# Altium project SnakeCard_RevC.PrjPcb
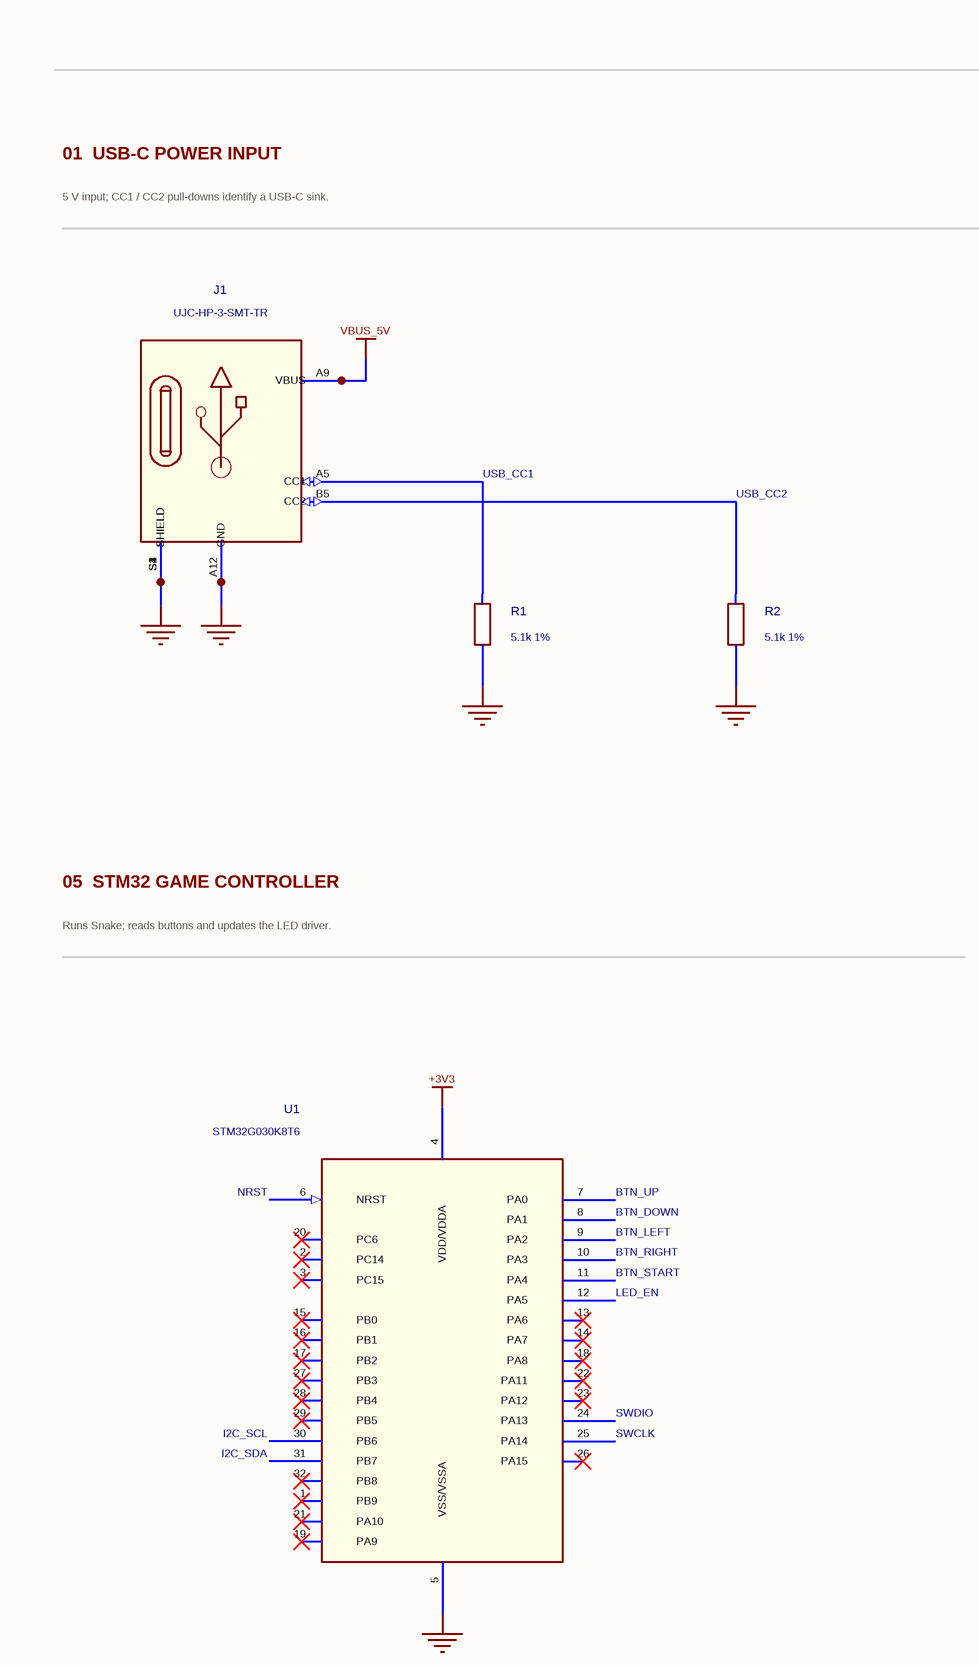
[diagram p0: SnakeCard_Native.SchDoc, top left]
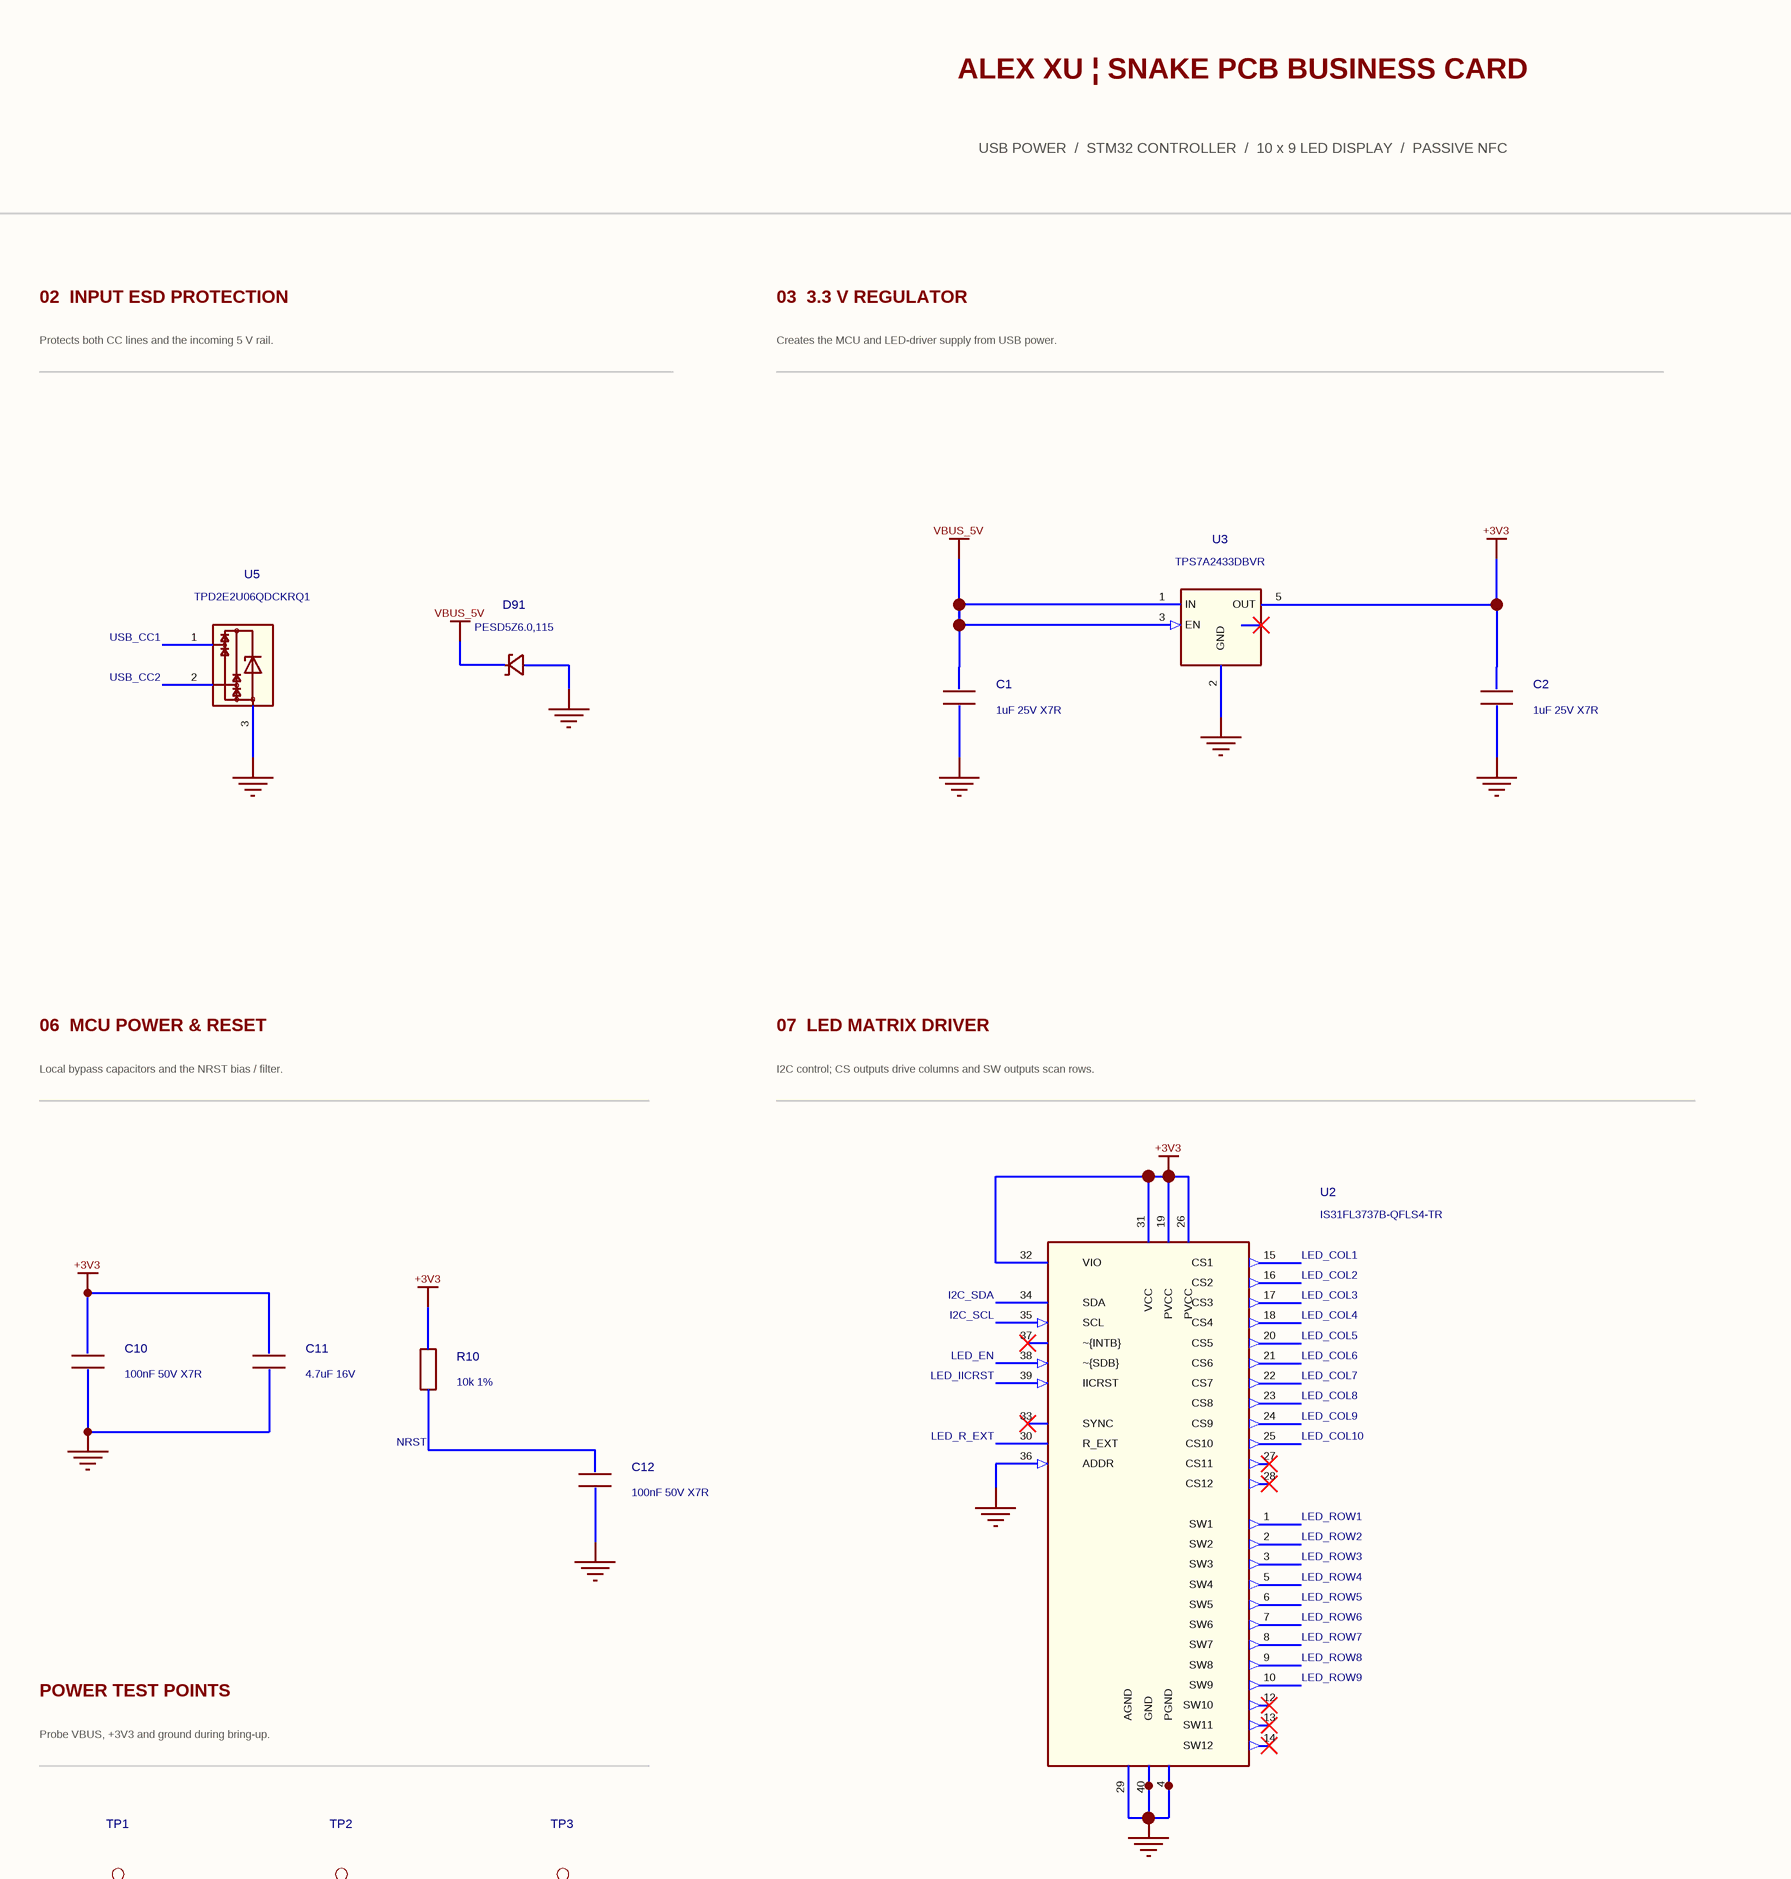
[diagram p1: SnakeCard_Native.SchDoc, top middle]
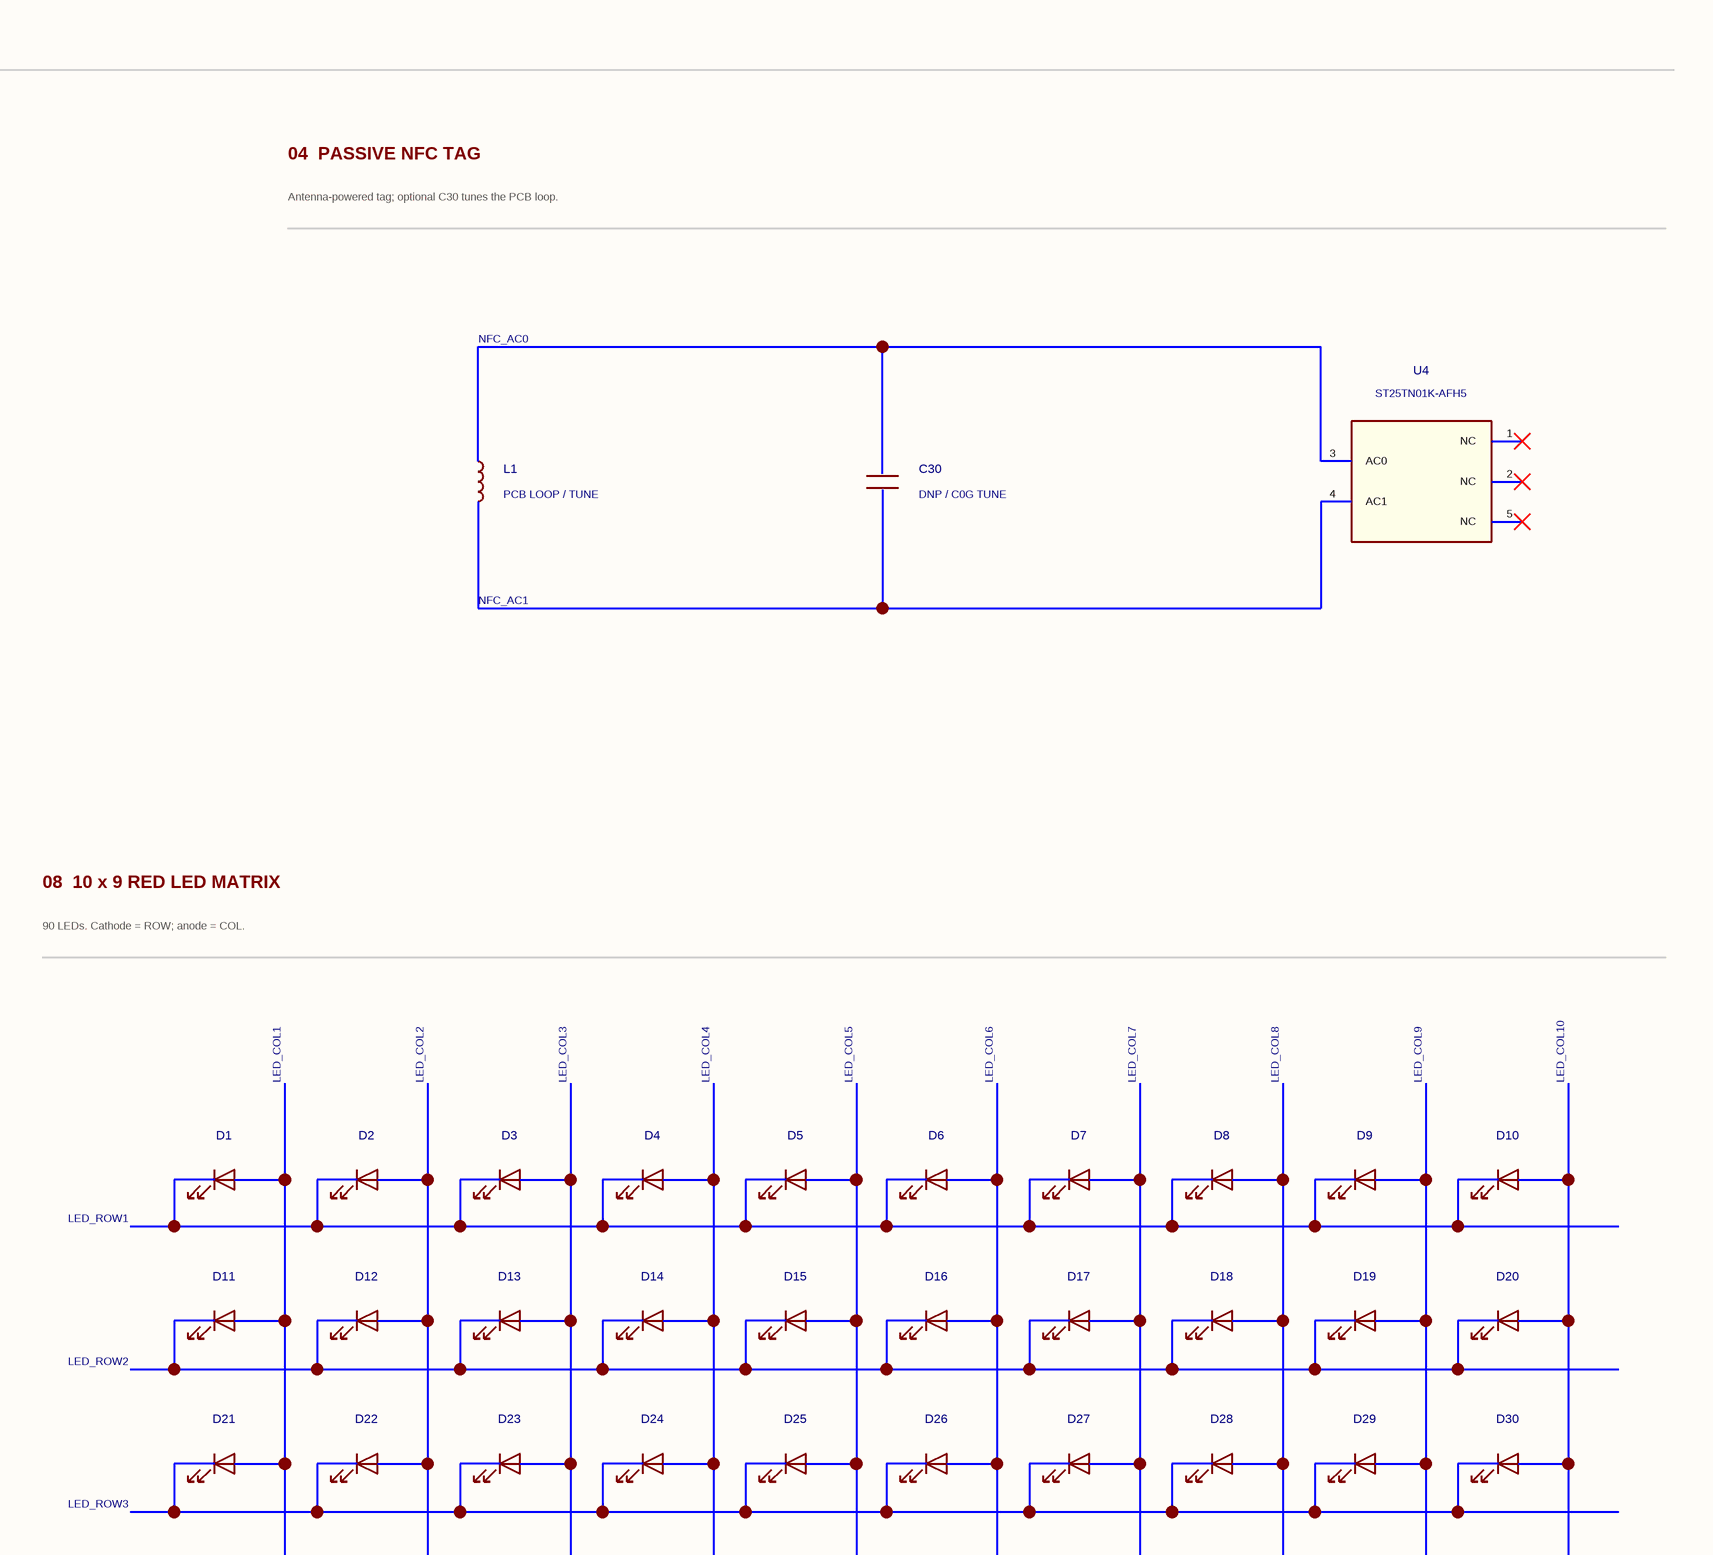
[diagram p2: SnakeCard_Native.SchDoc, top right]
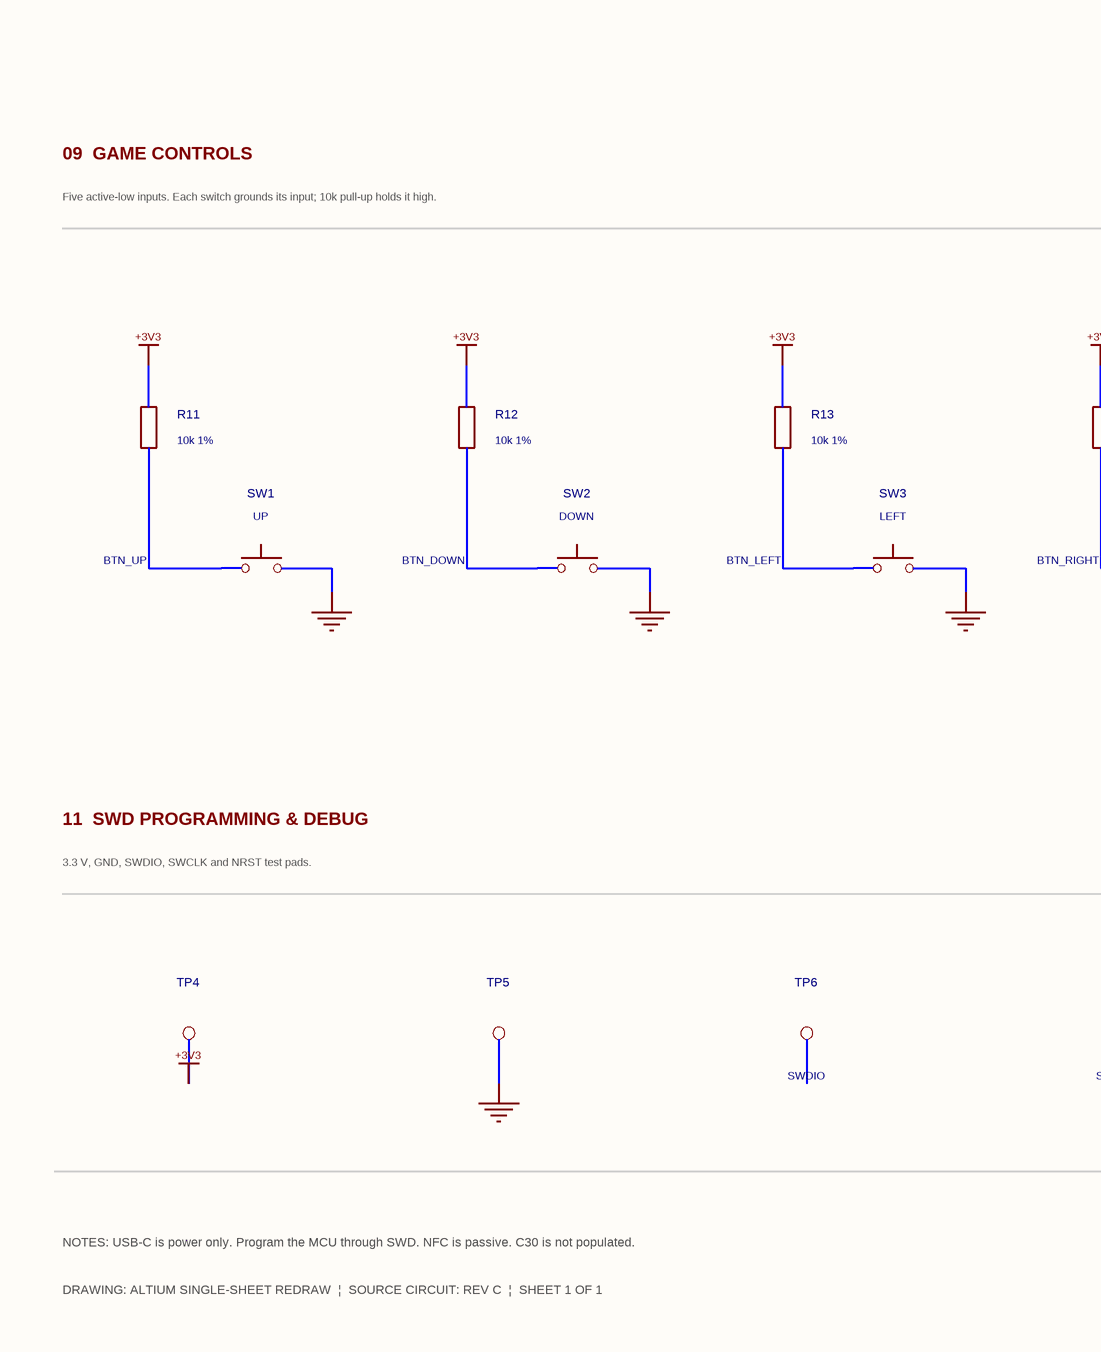
[diagram p3: SnakeCard_Native.SchDoc, bottom left]
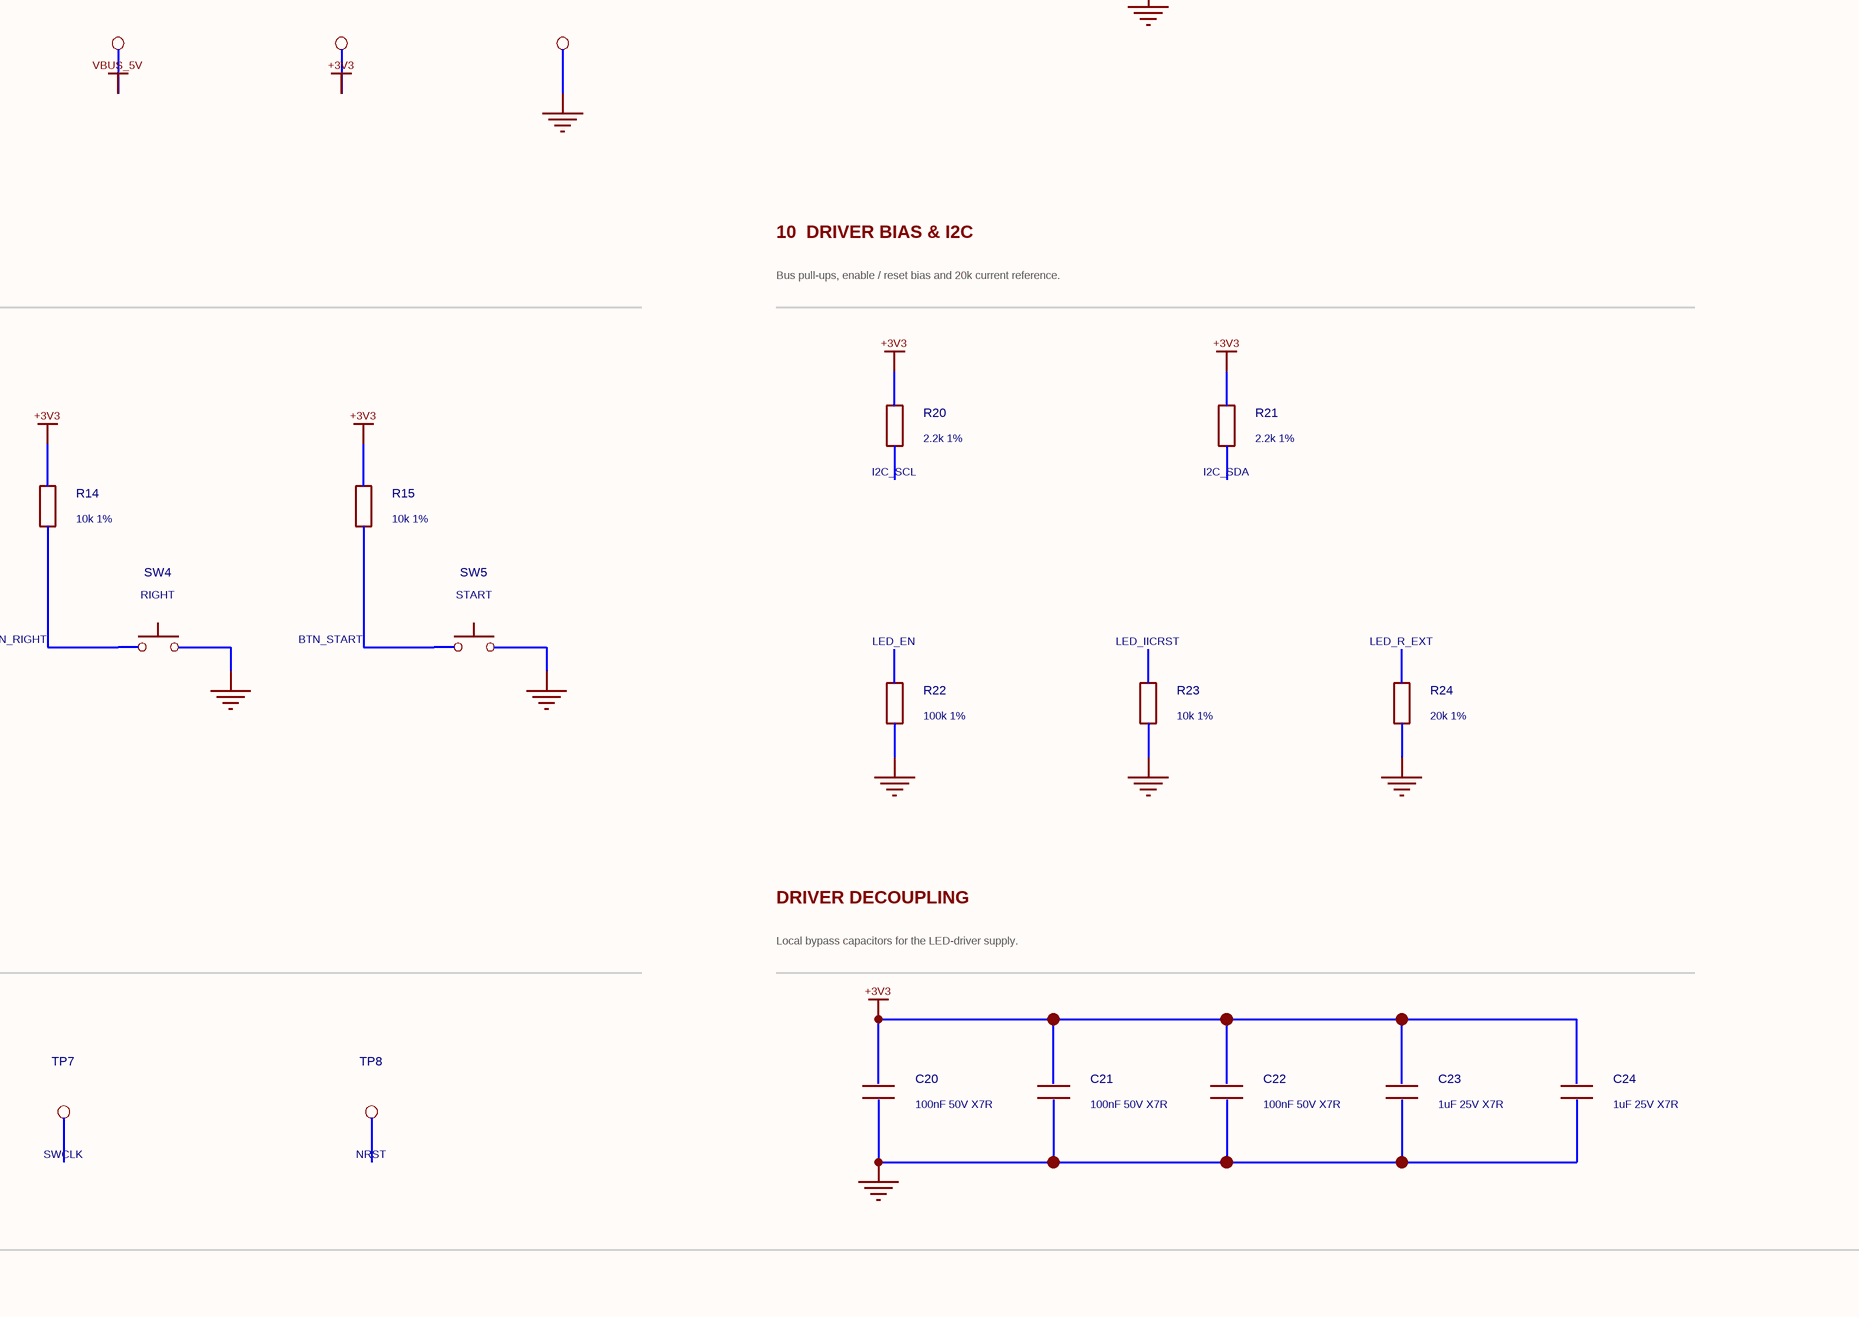
[diagram p4: SnakeCard_Native.SchDoc, bottom middle]
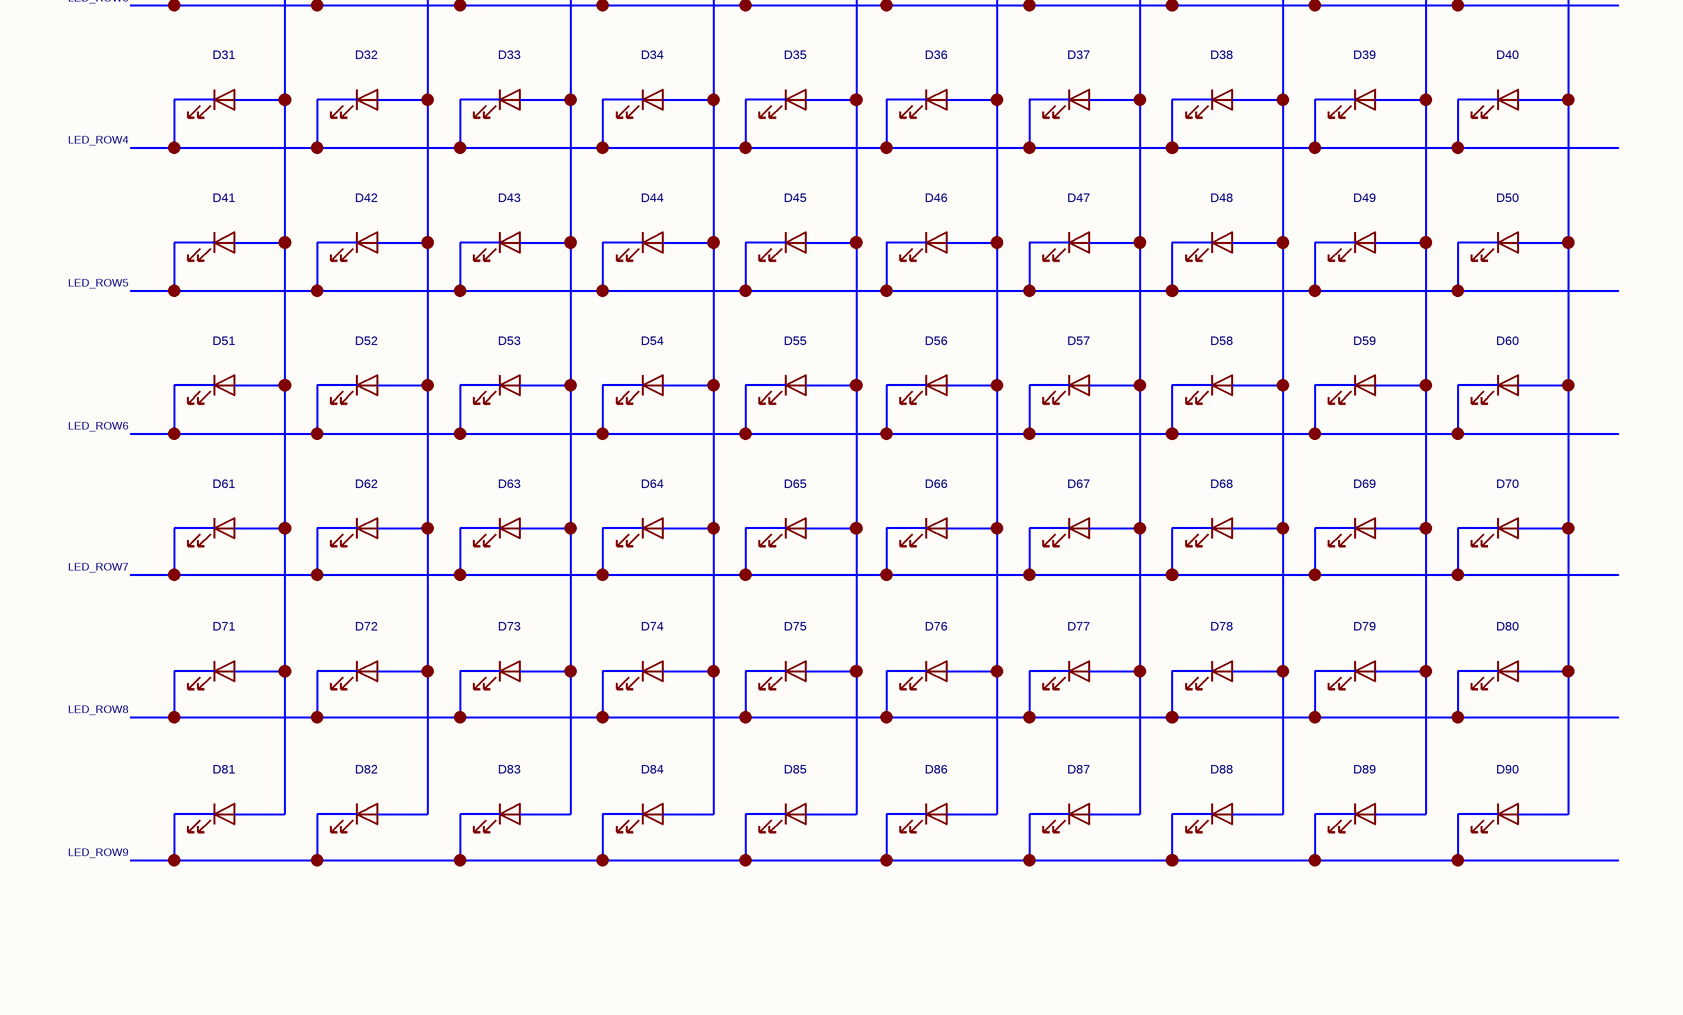
[diagram p5: SnakeCard_Native.SchDoc, bottom right]
1 sheet, 135 parts. Net scope: global (net labels, ports and power ports of the same name join across sheets).
Board file: SnakeCard_Native.PcbDoc

## Sheet SnakeCard_Native.SchDoc
size 594 x 419 mm

### Parts
C1  1uF 25V X7R  [C_0603_1608Metric]
C2  1uF 25V X7R  [C_0603_1608Metric]
C10  100nF 50V X7R  [C_0603_1608Metric]
C11  4.7uF 16V  [C_0603_1608Metric]
C12  100nF 50V X7R  [C_0603_1608Metric]
C20  100nF 50V X7R  [C_0603_1608Metric]
C21  100nF 50V X7R  [C_0603_1608Metric]
C22  100nF 50V X7R  [C_0603_1608Metric]
C23  1uF 25V X7R  [C_0603_1608Metric]
C24  1uF 25V X7R  [C_0603_1608Metric]
C30  DNP / C0G TUNE  [C_0603_1608Metric__DNP_NOPASTE]
D1  KT-0603R  [Kingbright_APT1608SURCK]  (value not drawn)
D2  KT-0603R  [Kingbright_APT1608SURCK]  (value not drawn)
D3  KT-0603R  [Kingbright_APT1608SURCK]  (value not drawn)
D4  KT-0603R  [Kingbright_APT1608SURCK]  (value not drawn)
D5  KT-0603R  [Kingbright_APT1608SURCK]  (value not drawn)
D6  KT-0603R  [Kingbright_APT1608SURCK]  (value not drawn)
D7  KT-0603R  [Kingbright_APT1608SURCK]  (value not drawn)
D8  KT-0603R  [Kingbright_APT1608SURCK]  (value not drawn)
D9  KT-0603R  [Kingbright_APT1608SURCK]  (value not drawn)
D10  KT-0603R  [Kingbright_APT1608SURCK]  (value not drawn)
D11  KT-0603R  [Kingbright_APT1608SURCK]  (value not drawn)
D12  KT-0603R  [Kingbright_APT1608SURCK]  (value not drawn)
D13  KT-0603R  [Kingbright_APT1608SURCK]  (value not drawn)
D14  KT-0603R  [Kingbright_APT1608SURCK]  (value not drawn)
D15  KT-0603R  [Kingbright_APT1608SURCK]  (value not drawn)
D16  KT-0603R  [Kingbright_APT1608SURCK]  (value not drawn)
D17  KT-0603R  [Kingbright_APT1608SURCK]  (value not drawn)
D18  KT-0603R  [Kingbright_APT1608SURCK]  (value not drawn)
D19  KT-0603R  [Kingbright_APT1608SURCK]  (value not drawn)
D20  KT-0603R  [Kingbright_APT1608SURCK]  (value not drawn)
D21  KT-0603R  [Kingbright_APT1608SURCK]  (value not drawn)
D22  KT-0603R  [Kingbright_APT1608SURCK]  (value not drawn)
D23  KT-0603R  [Kingbright_APT1608SURCK]  (value not drawn)
D24  KT-0603R  [Kingbright_APT1608SURCK]  (value not drawn)
D25  KT-0603R  [Kingbright_APT1608SURCK]  (value not drawn)
D26  KT-0603R  [Kingbright_APT1608SURCK]  (value not drawn)
D27  KT-0603R  [Kingbright_APT1608SURCK]  (value not drawn)
D28  KT-0603R  [Kingbright_APT1608SURCK]  (value not drawn)
D29  KT-0603R  [Kingbright_APT1608SURCK]  (value not drawn)
D30  KT-0603R  [Kingbright_APT1608SURCK]  (value not drawn)
D31  KT-0603R  [Kingbright_APT1608SURCK]  (value not drawn)
D32  KT-0603R  [Kingbright_APT1608SURCK]  (value not drawn)
D33  KT-0603R  [Kingbright_APT1608SURCK]  (value not drawn)
D34  KT-0603R  [Kingbright_APT1608SURCK]  (value not drawn)
D35  KT-0603R  [Kingbright_APT1608SURCK]  (value not drawn)
D36  KT-0603R  [Kingbright_APT1608SURCK]  (value not drawn)
D37  KT-0603R  [Kingbright_APT1608SURCK]  (value not drawn)
D38  KT-0603R  [Kingbright_APT1608SURCK]  (value not drawn)
D39  KT-0603R  [Kingbright_APT1608SURCK]  (value not drawn)
D40  KT-0603R  [Kingbright_APT1608SURCK]  (value not drawn)
D41  KT-0603R  [Kingbright_APT1608SURCK]  (value not drawn)
D42  KT-0603R  [Kingbright_APT1608SURCK]  (value not drawn)
D43  KT-0603R  [Kingbright_APT1608SURCK]  (value not drawn)
D44  KT-0603R  [Kingbright_APT1608SURCK]  (value not drawn)
D45  KT-0603R  [Kingbright_APT1608SURCK]  (value not drawn)
D46  KT-0603R  [Kingbright_APT1608SURCK]  (value not drawn)
D47  KT-0603R  [Kingbright_APT1608SURCK]  (value not drawn)
D48  KT-0603R  [Kingbright_APT1608SURCK]  (value not drawn)
D49  KT-0603R  [Kingbright_APT1608SURCK]  (value not drawn)
D50  KT-0603R  [Kingbright_APT1608SURCK]  (value not drawn)
D51  KT-0603R  [Kingbright_APT1608SURCK]  (value not drawn)
D52  KT-0603R  [Kingbright_APT1608SURCK]  (value not drawn)
D53  KT-0603R  [Kingbright_APT1608SURCK]  (value not drawn)
D54  KT-0603R  [Kingbright_APT1608SURCK]  (value not drawn)
D55  KT-0603R  [Kingbright_APT1608SURCK]  (value not drawn)
D56  KT-0603R  [Kingbright_APT1608SURCK]  (value not drawn)
D57  KT-0603R  [Kingbright_APT1608SURCK]  (value not drawn)
D58  KT-0603R  [Kingbright_APT1608SURCK]  (value not drawn)
D59  KT-0603R  [Kingbright_APT1608SURCK]  (value not drawn)
D60  KT-0603R  [Kingbright_APT1608SURCK]  (value not drawn)
D61  KT-0603R  [Kingbright_APT1608SURCK]  (value not drawn)
D62  KT-0603R  [Kingbright_APT1608SURCK]  (value not drawn)
D63  KT-0603R  [Kingbright_APT1608SURCK]  (value not drawn)
D64  KT-0603R  [Kingbright_APT1608SURCK]  (value not drawn)
D65  KT-0603R  [Kingbright_APT1608SURCK]  (value not drawn)
D66  KT-0603R  [Kingbright_APT1608SURCK]  (value not drawn)
D67  KT-0603R  [Kingbright_APT1608SURCK]  (value not drawn)
D68  KT-0603R  [Kingbright_APT1608SURCK]  (value not drawn)
D69  KT-0603R  [Kingbright_APT1608SURCK]  (value not drawn)
D70  KT-0603R  [Kingbright_APT1608SURCK]  (value not drawn)
D71  KT-0603R  [Kingbright_APT1608SURCK]  (value not drawn)
D72  KT-0603R  [Kingbright_APT1608SURCK]  (value not drawn)
D73  KT-0603R  [Kingbright_APT1608SURCK]  (value not drawn)
D74  KT-0603R  [Kingbright_APT1608SURCK]  (value not drawn)
D75  KT-0603R  [Kingbright_APT1608SURCK]  (value not drawn)
D76  KT-0603R  [Kingbright_APT1608SURCK]  (value not drawn)
D77  KT-0603R  [Kingbright_APT1608SURCK]  (value not drawn)
D78  KT-0603R  [Kingbright_APT1608SURCK]  (value not drawn)
D79  KT-0603R  [Kingbright_APT1608SURCK]  (value not drawn)
D80  KT-0603R  [Kingbright_APT1608SURCK]  (value not drawn)
D81  KT-0603R  [Kingbright_APT1608SURCK]  (value not drawn)
D82  KT-0603R  [Kingbright_APT1608SURCK]  (value not drawn)
D83  KT-0603R  [Kingbright_APT1608SURCK]  (value not drawn)
D84  KT-0603R  [Kingbright_APT1608SURCK]  (value not drawn)
D85  KT-0603R  [Kingbright_APT1608SURCK]  (value not drawn)
D86  KT-0603R  [Kingbright_APT1608SURCK]  (value not drawn)
D87  KT-0603R  [Kingbright_APT1608SURCK]  (value not drawn)
D88  KT-0603R  [Kingbright_APT1608SURCK]  (value not drawn)
D89  KT-0603R  [Kingbright_APT1608SURCK]  (value not drawn)
D90  KT-0603R  [Kingbright_APT1608SURCK]  (value not drawn)
D91  PESD5Z6.0,115  [D_SOD-523]
J1  UJC-HP-3-SMT-TR  [CUI_UJC-HP-3-SMT-TR]
L1  PCB LOOP / TUNE  [NFC_PRINTED_COIL_8T_UNTUNED]  (net tie, no BOM)
R1  5.1k 1%  [R_0603_1608Metric]
R2  5.1k 1%  [R_0603_1608Metric]
R10  10k 1%  [R_0603_1608Metric]
R11  10k 1%  [R_0603_1608Metric]
R12  10k 1%  [R_0603_1608Metric]
R13  10k 1%  [R_0603_1608Metric]
R14  10k 1%  [R_0603_1608Metric]
R15  10k 1%  [R_0603_1608Metric]
R20  2.2k 1%  [R_0603_1608Metric]
R21  2.2k 1%  [R_0603_1608Metric]
R22  100k 1%  [R_0603_1608Metric]
R23  10k 1%  [R_0603_1608Metric]
R24  20k 1%  [R_0603_1608Metric]
SW1  UP  [SW_SPST_SKQG_WithStem__HAND_SOLDER_NOPASTE]
SW2  DOWN  [SW_SPST_SKQG_WithStem__HAND_SOLDER_NOPASTE]
SW3  LEFT  [SW_SPST_SKQG_WithStem__HAND_SOLDER_NOPASTE]
SW4  RIGHT  [SW_SPST_SKQG_WithStem__HAND_SOLDER_NOPASTE]
SW5  START  [SW_SPST_SKQG_WithStem__HAND_SOLDER_NOPASTE]
TP1  VBUS_5V  [TestPoint_Pad_D1.0mm]  (value not drawn)
TP2  +3V3  [TestPoint_Pad_D1.0mm]  (value not drawn)
TP3  GND  [TestPoint_Pad_D1.0mm]  (value not drawn)
TP4  +3V3  [TestPoint_Pad_D1.0mm]  (value not drawn)
TP5  GND  [TestPoint_Pad_D1.0mm]  (value not drawn)
TP6  SWDIO  [TestPoint_Pad_D1.0mm]  (value not drawn)
TP7  SWCLK  [TestPoint_Pad_D1.0mm]  (value not drawn)
TP8  NRST  [TestPoint_Pad_D1.0mm]  (value not drawn)
U1  STM32G030K8T6  [LQFP-32_7x7mm_P0.8mm]
U2  IS31FL3737B-QFLS4-TR  [IS31FL3737_QFN40_5x5mm_P0.4mm_EP3.4mm]
U3  TPS7A2433DBVR  [SOT-23-5]
U4  ST25TN01K-AFH5  [ST25TN01K_UFDFPN5_1.7x1.4mm]
U5  TPD2E2U06QDCKRQ1  [SOT-323_SC-70]

### Nets
+3V3: C2.1 C10.1 C11.1 C20.1 C21.1 C22.1 C23.1 C24.1 R10.1 R11.1 R12.1 R13.1 R14.1 R15.1 R20.1 R21.1 TP2.1 TP4.1 U1.4(VDD/VDDA) U2.19(PVCC) U2.26(PVCC) U2.31(VCC) U2.32(VIO) U3.5(OUT)
GND: C1.2 C2.2 C10.2 C11.2 C12.2 C20.2 C21.2 C22.2 C23.2 C24.2 D91.2(A) J1.A12(GND) J1.B12(GND) J1.S1(SHIELD) J1.S2(SHIELD) J1.S3(SHIELD) J1.S4(SHIELD) R1.2 R2.2 R22.2 R23.2 R24.2 SW1.2 SW2.2 SW3.2 SW4.2 SW5.2 TP3.1 TP5.1 U1.5(VSS/VSSA) U2.4(PGND) U2.11(PGND) U2.29(AGND) U2.36(ADDR) U2.40(GND) U2.41(GND) U3.2(GND) U5.3
VBUS_5V: C1.1 D91.1(K) J1.A9(VBUS) J1.B9(VBUS) TP1.1 U3.1(IN) U3.3(EN)
BTN_DOWN: R12.2 SW2.1 U1.8(PA1)
BTN_LEFT: R13.2 SW3.1 U1.9(PA2)
BTN_RIGHT: R14.2 SW4.1 U1.10(PA3)
BTN_START: R15.2 SW5.1 U1.11(PA4)
BTN_UP: R11.2 SW1.1 U1.7(PA0)
I2C_SCL: R20.2 U1.30(PB6) U2.35(SCL)
I2C_SDA: R21.2 U1.31(PB7) U2.34(SDA)
LED_COL1: D1.2(A) D11.2(A) D21.2(A) D31.2(A) D41.2(A) D51.2(A) D61.2(A) D71.2(A) D81.2(A) U2.15(CS1)
LED_COL2: D2.2(A) D12.2(A) D22.2(A) D32.2(A) D42.2(A) D52.2(A) D62.2(A) D72.2(A) D82.2(A) U2.16(CS2)
LED_COL3: D3.2(A) D13.2(A) D23.2(A) D33.2(A) D43.2(A) D53.2(A) D63.2(A) D73.2(A) D83.2(A) U2.17(CS3)
LED_COL4: D4.2(A) D14.2(A) D24.2(A) D34.2(A) D44.2(A) D54.2(A) D64.2(A) D74.2(A) D84.2(A) U2.18(CS4)
LED_COL5: D5.2(A) D15.2(A) D25.2(A) D35.2(A) D45.2(A) D55.2(A) D65.2(A) D75.2(A) D85.2(A) U2.20(CS5)
LED_COL6: D6.2(A) D16.2(A) D26.2(A) D36.2(A) D46.2(A) D56.2(A) D66.2(A) D76.2(A) D86.2(A) U2.21(CS6)
LED_COL7: D7.2(A) D17.2(A) D27.2(A) D37.2(A) D47.2(A) D57.2(A) D67.2(A) D77.2(A) D87.2(A) U2.22(CS7)
LED_COL8: D8.2(A) D18.2(A) D28.2(A) D38.2(A) D48.2(A) D58.2(A) D68.2(A) D78.2(A) D88.2(A) U2.23(CS8)
LED_COL9: D9.2(A) D19.2(A) D29.2(A) D39.2(A) D49.2(A) D59.2(A) D69.2(A) D79.2(A) D89.2(A) U2.24(CS9)
LED_COL10: D10.2(A) D20.2(A) D30.2(A) D40.2(A) D50.2(A) D60.2(A) D70.2(A) D80.2(A) D90.2(A) U2.25(CS10)
LED_EN: R22.1 U1.12(PA5) U2.38(~{SDB})
LED_IICRST: R23.1 U2.39(IICRST)
LED_R_EXT: R24.1 U2.30(R_EXT)
LED_ROW1: D1.1(K) D2.1(K) D3.1(K) D4.1(K) D5.1(K) D6.1(K) D7.1(K) D8.1(K) D9.1(K) D10.1(K) U2.1(SW1)
LED_ROW2: D11.1(K) D12.1(K) D13.1(K) D14.1(K) D15.1(K) D16.1(K) D17.1(K) D18.1(K) D19.1(K) D20.1(K) U2.2(SW2)
LED_ROW3: D21.1(K) D22.1(K) D23.1(K) D24.1(K) D25.1(K) D26.1(K) D27.1(K) D28.1(K) D29.1(K) D30.1(K) U2.3(SW3)
LED_ROW4: D31.1(K) D32.1(K) D33.1(K) D34.1(K) D35.1(K) D36.1(K) D37.1(K) D38.1(K) D39.1(K) D40.1(K) U2.5(SW4)
LED_ROW5: D41.1(K) D42.1(K) D43.1(K) D44.1(K) D45.1(K) D46.1(K) D47.1(K) D48.1(K) D49.1(K) D50.1(K) U2.6(SW5)
LED_ROW6: D51.1(K) D52.1(K) D53.1(K) D54.1(K) D55.1(K) D56.1(K) D57.1(K) D58.1(K) D59.1(K) D60.1(K) U2.7(SW6)
LED_ROW7: D61.1(K) D62.1(K) D63.1(K) D64.1(K) D65.1(K) D66.1(K) D67.1(K) D68.1(K) D69.1(K) D70.1(K) U2.8(SW7)
LED_ROW8: D71.1(K) D72.1(K) D73.1(K) D74.1(K) D75.1(K) D76.1(K) D77.1(K) D78.1(K) D79.1(K) D80.1(K) U2.9(SW8)
LED_ROW9: D81.1(K) D82.1(K) D83.1(K) D84.1(K) D85.1(K) D86.1(K) D87.1(K) D88.1(K) D89.1(K) D90.1(K) U2.10(SW9)
NFC_AC0: C30.1 L1.1 U4.3(AC0)
NFC_AC1: C30.2 L1.2 U4.4(AC1)
NRST: C12.1 R10.2 TP8.1 U1.6(NRST)
SWCLK: TP7.1 U1.25(PA14)
SWDIO: TP6.1 U1.24(PA13)
USB_CC1: J1.A5(CC1) R1.1 U5.1
USB_CC2: J1.B5(CC2) R2.1 U5.2

Not connected (* = marked no-connect by the designer): U1 1(PB9)* 2(PC14)* 3(PC15)* 13(PA6)* 14(PA7)* 15(PB0)* 16(PB1)* 17(PB2)* 18(PA8)* 19(PA9)* 20(PC6)* 21(PA10)* 22(PA11)* 23(PA12)* 26(PA15)* 27(PB3)* 28(PB4)* 29(PB5)* 32(PB8)*; U2 12(SW10)* 13(SW11)* 14(SW12)* 27(CS11)* 28(CS12)* 33(SYNC)* 37(~{INTB})*; U3 4(NC)*; U4 1(NC)* 2(NC)* 5(NC)*

### Notes on the sheet
- ALEX XU | SNAKE PCB BUSINESS CARD
- USB POWER  /  STM32 CONTROLLER  /  10 x 9 LED DISPLAY  /  PASSIVE NFC
- 01  USB-C POWER INPUT
- 02  INPUT ESD PROTECTION
- 03  3.3 V REGULATOR
- 04  PASSIVE NFC TAG
- 5 V input; CC1 / CC2 pull-downs identify a USB-C sink.
- Protects both CC lines and the incoming 5 V rail.
- Creates the MCU and LED-driver supply from USB power.
- Antenna-powered tag; optional C30 tunes the PCB loop.
- 05  STM32 GAME CONTROLLER
- Runs Snake; reads buttons and updates the LED driver.
- 06  MCU POWER & RESET
- Local bypass capacitors and the NRST bias / filter.
- 07  LED MATRIX DRIVER
- I2C control; CS outputs drive columns and SW outputs scan rows.
- 08  10 x 9 RED LED MATRIX
- 90 LEDs. Cathode = ROW; anode = COL.
- POWER TEST POINTS
- Probe VBUS, +3V3 and ground during bring-up.
- 09  GAME CONTROLS
- Five active-low inputs. Each switch grounds its input; 10k pull-up holds it high.
- 10  DRIVER BIAS & I2C
- Bus pull-ups, enable / reset bias and 20k current reference.
- 11  SWD PROGRAMMING & DEBUG
- 3.3 V, GND, SWDIO, SWCLK and NRST test pads.
- DRIVER DECOUPLING
- Local bypass capacitors for the LED-driver supply.
- NOTES: USB-C is power only. Program the MCU through SWD. NFC is passive. C30 is not populated.
- DRAWING: ALTIUM SINGLE-SHEET REDRAW  |  SOURCE CIRCUIT: REV C  |  SHEET 1 OF 1

### Library data of the parts
C1 C2 C23 C24 = C: 1 uF; 25 V; X7R; 0603; Manufacturer: Samsung Electro-Mechanics; Manufacturer_Part_Number: CL10B105KA8NNNC; Source_Footprint: Capacitor_SMD:C_0603_1608Metric; Assembly_Variant: SC-REVC-LCSC-P1; Assembly_Status: Prototype qualification pending; Fitted: Yes; Source_Datasheet: https://product.samsungsem.com/mlcc/CL10B105KA8NNN.do; Supplier: LCSC; Supplier_Part_Number: C29936; Datasheet: https://product.samsungsem.com/mlcc/CL10B105KA8NNN.do
C10 C12 C20-C22 = C: 100 nF; 50 V; X7R; 0603; Manufacturer: Yageo; Manufacturer_Part_Number: CC0603KRX7R9BB104; Source_Footprint: Capacitor_SMD:C_0603_1608Metric; Assembly_Variant: SC-REVC-LCSC-P1; Assembly_Status: Prototype qualification pending; Fitted: Yes; Source_Datasheet: https://yageogroup.com/download/specsheet/CC0603KRX7R9BB104; Supplier: LCSC; Supplier_Part_Number: C14663; Datasheet: https://yageogroup.com/download/specsheet/CC0603KRX7R9BB104
C11 = C: 4.7 uF; 16 V; 0603; ceramic; Manufacturer: Murata; Manufacturer_Part_Number: GRM188Z71C475KE21D; Source_Footprint: Capacitor_SMD:C_0603_1608Metric; Assembly_Variant: SC-REVC-LCSC-P1; Assembly_Status: Prototype qualification pending; Fitted: Yes; Source_Datasheet: https://search.murata.co.jp/Ceramy/image/img/A01X/G101/ENG/GRM188Z71C475KE21-01A.pdf; Supplier: LCSC; Supplier_Part_Number: C389010; Datasheet: https://search.murata.co.jp/Ceramy/image/img/A01X/G101/ENG/GRM188Z71C475KE21-01A.pdf
C30 = C: Source_Footprint: Capacitor_SMD:C_0603_1608Metric; Assembly: DNP; Assembly_Variant: SC-REVC-LCSC-P1; Assembly_Status: DNP pending RF tuning; Fitted: No; DNP_Reason: NFC tuning; no approved value
D1-D90 = LED: Red 1608 LED; Manufacturer: Hubei KENTO; Source_Footprint: SnakeCard:Kingbright_APT1608SURCK; Assembly_Variant: SC-REVC-LCSC-P1; Assembly_Status: Prototype qualification pending; Fitted: Yes; Source_Datasheet: https://datasheet.lcsc.com/datasheet/pdf/011ec3e8cb1e825f6961d29bc4db4c7a.pdf; Manufacturer_Part_Number: KT-0603R; Supplier: LCSC; Supplier_Part_Number: C2286; Datasheet: https://datasheet.lcsc.com/datasheet/pdf/011ec3e8cb1e825f6961d29bc4db4c7a.pdf
D91 = D_TVS: 6 V unidirectional TVS; SOD523; Manufacturer: Nexperia; Source_Footprint: Diode_SMD:D_SOD-523; Assembly_Variant: SC-REVC-LCSC-P1; Assembly_Status: Prototype qualification pending; Fitted: Yes; Source_Datasheet: https://assets.nexperia.com/documents/data-sheet/PESD5Z6_0.pdf; Manufacturer_Part_Number: PESD5Z6.0,115; Supplier: LCSC; Supplier_Part_Number: C461166; Datasheet: https://assets.nexperia.com/documents/data-sheet/PESD5Z6_0.pdf
J1 = USB_C_Receptacle_PowerOnly_6P: USB-C power-only receptacle; 0.8 mm PCB; Manufacturer: Same Sky; Source_Footprint: SnakeCard:CUI_UJC-HP-3-SMT-TR; Assembly_Variant: SC-REVC-LCSC-P1; Assembly_Status: Prototype qualification pending; Fitted: Yes; Source_Datasheet: https://www.sameskydevices.com/product/resource/ujc-hp-3-smt-tr.pdf; Manufacturer_Part_Number: UJC-HP-3-SMT-TR; Supplier: LCSC; Supplier_Part_Number: C3198015; Datasheet: https://www.sameskydevices.com/product/resource/ujc-hp-3-smt-tr.pdf
L1 = L: Assembly_Variant: SC-REVC-LCSC-P1; Assembly_Status: PCB feature; no purchased component; Fitted: No; DNP_Reason: Printed PCB feature; no purchased component
R1 R2 = R: 5.1 kohm; 1%; 0603; Manufacturer: Panasonic; Manufacturer_Part_Number: ERJ3EKF5101V; Source_Footprint: Resistor_SMD:R_0603_1608Metric; Assembly_Variant: SC-REVC-LCSC-P1; Assembly_Status: Prototype qualification pending; Fitted: Yes; Source_Datasheet: https://industrial.panasonic.com/cdbs/www-data/pdf/RDA0000/AOA0000C304.pdf; Supplier: LCSC; Supplier_Part_Number: C123727; Datasheet: https://industrial.panasonic.com/cdbs/www-data/pdf/RDA0000/AOA0000C304.pdf
R10-R15 R23 = R: 10 kohm; 1%; 0603; Manufacturer: Panasonic; Manufacturer_Part_Number: ERJ3EKF1002V; Source_Footprint: Resistor_SMD:R_0603_1608Metric; Assembly_Variant: SC-REVC-LCSC-P1; Assembly_Status: Prototype qualification pending; Fitted: Yes; Source_Datasheet: https://industrial.panasonic.com/cdbs/www-data/pdf/RDA0000/AOA0000C304.pdf; Supplier: LCSC; Supplier_Part_Number: C191124; Datasheet: https://industrial.panasonic.com/cdbs/www-data/pdf/RDA0000/AOA0000C304.pdf
R20 R21 = R: 2.2 kohm; 1%; 0603; Manufacturer: Panasonic; Manufacturer_Part_Number: ERJ3EKF2201V; Source_Footprint: Resistor_SMD:R_0603_1608Metric; Assembly_Variant: SC-REVC-LCSC-P1; Assembly_Status: Prototype qualification pending; Fitted: Yes; Source_Datasheet: https://industrial.panasonic.com/cdbs/www-data/pdf/RDA0000/AOA0000C304.pdf; Supplier: LCSC; Supplier_Part_Number: C116387; Datasheet: https://industrial.panasonic.com/cdbs/www-data/pdf/RDA0000/AOA0000C304.pdf
R22 = R: 100 kohm; 1%; 0603; Manufacturer: UNI-ROYAL; Manufacturer_Part_Number: 0603WAF1003T5E; Source_Footprint: Resistor_SMD:R_0603_1608Metric; Assembly_Variant: SC-REVC-LCSC-P1; Assembly_Status: Prototype qualification pending; Fitted: Yes; Source_Datasheet: https://datasheet.lcsc.com/datasheet/pdf/0a975aaa49b7c97f38a963127be4a823.pdf; Supplier: LCSC; Supplier_Part_Number: C25803; Datasheet: https://datasheet.lcsc.com/datasheet/pdf/0a975aaa49b7c97f38a963127be4a823.pdf
R24 = R: 20 kohm; 1%; 0603; driver REXT; Manufacturer: Panasonic; Manufacturer_Part_Number: ERJ3EKF2002V; Source_Footprint: Resistor_SMD:R_0603_1608Metric; Assembly_Variant: SC-REVC-LCSC-P1; Assembly_Status: Prototype qualification pending; Fitted: Yes; Source_Datasheet: https://industrial.panasonic.com/cdbs/www-data/pdf/RDA0000/AOA0000C304.pdf; Supplier: LCSC; Supplier_Part_Number: C403057; Datasheet: https://industrial.panasonic.com/cdbs/www-data/pdf/RDA0000/AOA0000C304.pdf
SW1-SW5 = SW_Push: Tactile switch; manual solder after reflow; Manufacturer: Alps Alpine; Manufacturer_Part_Number: SKQGABE010; Source_Footprint: Button_Switch_SMD:SW_SPST_SKQG_WithStem; Assembly_Variant: SC-REVC-LCSC-P1; Assembly_Status: Prototype qualification pending; Fitted: Yes; Source_Datasheet: https://tech.alpsalpine.com/cms.media/SKQGAB_KQG_719_EN_cc4e10226e.pdf; Supplier: LCSC; Supplier_Part_Number: C115351; Datasheet: https://tech.alpsalpine.com/cms.media/SKQGAB_KQG_719_EN_cc4e10226e.pdf
TP1-TP8 = TestPoint: Source_Footprint: TestPoint:TestPoint_Pad_D1.0mm; Assembly_Variant: SC-REVC-LCSC-P1; Assembly_Status: PCB feature; no purchased component; Fitted: No; DNP_Reason: Printed PCB feature; no purchased component
U1 = STM32G030K8Tx: STM32G0 MCU; LQFP-32; Manufacturer: STMicroelectronics; Source_Footprint: Package_QFP:LQFP-32_7x7mm_P0.8mm; Assembly_Variant: SC-REVC-LCSC-P1; Assembly_Status: Prototype qualification pending; Fitted: Yes; Source_Datasheet: https://www.st.com/resource/en/datasheet/stm32g030k8.pdf; Manufacturer_Part_Number: STM32G030K8T6; Supplier: LCSC; Supplier_Part_Number: C431631; Datasheet: https://www.st.com/resource/en/datasheet/stm32g030k8.pdf
U2 = IS31FL3737: LED matrix driver; QFN-40 with exposed GND pad; Manufacturer: Lumissil / ISSI; Source_Footprint: SnakeCard:IS31FL3737_QFN40_5x5mm_P0.4mm_EP3.4mm; Assembly_Variant: SC-REVC-LCSC-P1; Assembly_Status: Prototype qualification pending; Fitted: Yes; Source_Datasheet: https://www.lumissil.com/assets/pdf/core/IS31FL3737B_DS.pdf; Manufacturer_Part_Number: IS31FL3737B-QFLS4-TR; Supplier: LCSC; Supplier_Part_Number: C2940515; Datasheet: https://www.lumissil.com/assets/pdf/core/IS31FL3737B_DS.pdf
U3 = TLV75533PDBV: 3.3 V LDO; DBV SOT-23-5; 18 V operating input; Manufacturer: Texas Instruments; Source_Footprint: Package_TO_SOT_SMD:SOT-23-5; Assembly_Variant: SC-REVC-LCSC-P1; Assembly_Status: Prototype qualification pending; Fitted: Yes; Source_Datasheet: https://www.ti.com/lit/ds/symlink/tps7a24.pdf; Manufacturer_Part_Number: TPS7A2433DBVR; Supplier: LCSC; Supplier_Part_Number: C2866134; Datasheet: https://www.ti.com/lit/ds/symlink/tps7a24.pdf
U4 = ST25TN01K_AFH5: Passive NFC tag; UFDFPN5; Manufacturer: STMicroelectronics; Source_Footprint: SnakeCard:ST25TN01K_UFDFPN5_1.7x1.4mm; Assembly_Variant: SC-REVC-LCSC-P1; Assembly_Status: Prototype qualification pending; Fitted: Yes; Source_Datasheet: https://www.st.com/resource/en/datasheet/st25tn01k.pdf; Manufacturer_Part_Number: ST25TN01K-AFH5; Supplier: LCSC; Supplier_Part_Number: C3303589; Datasheet: https://www.st.com/resource/en/datasheet/st25tn01k.pdf
U5 = TPD2E2U06DCK: Dual CC-line ESD protection; DCK SC70-3; Manufacturer: Texas Instruments; Source_Footprint: Package_TO_SOT_SMD:SOT-323_SC-70; Assembly_Variant: SC-REVC-LCSC-P1; Assembly_Status: Prototype qualification pending; Fitted: Yes; Source_Datasheet: https://www.ti.com/lit/ds/symlink/tpd2e2u06-q1.pdf; Manufacturer_Part_Number: TPD2E2U06QDCKRQ1; Supplier: LCSC; Supplier_Part_Number: C915089; Datasheet: https://www.ti.com/lit/ds/symlink/tpd2e2u06-q1.pdf